# EAGLE design Weather_Station (EAGLE 9.6.2)
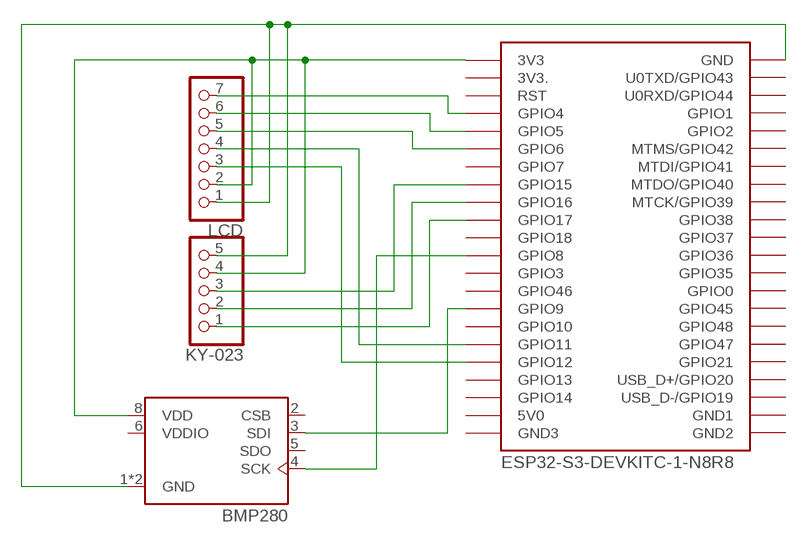
[diagram p0: schematic, sheet 1]

## Parts
KY-023  PINHD-1X5  [1X05]
LCD  PINHD-1X7  [1X07]
U1  BMP280  [XDCR_BMP280]
U$1  ESP32-S3-DEVKITC-1-N8R8  [ESP32-S3-DEVKITC-1-N8R8]

## Nets
N$1: LCD.7 U$1.J1_4(GPIO4)
N$2: LCD.6 U$1.J1_5(GPIO5)
N$3: LCD.5 U$1.J1_6(GPIO6)
N$4: KY-023.3 U$1.J1_8(GPIO15)
N$5: KY-023.2 U$1.J1_9(GPIO16)
N$6: KY-023.1 U$1.J1_10(GPIO17)
N$7: KY-023.4 LCD.2 U1.8(VDD) U$1.J1_1(3V3)
N$8: KY-023.5 LCD.1 U1.1(GND) U1.7(GND) U$1.J3_1(GND)
N$9: U1.4(SCK) U$1.J1_12(GPIO8)
N$10: LCD.4 U$1.J1_17(GPIO11)
N$11: LCD.3 U$1.J1_18(GPIO12)
N$12: U1.3(SDI) U$1.J1_15(GPIO9)
Unconnected: U1.2(CSB) U1.5(SDO) U$1.J1_3(RST) U$1.J1_7(GPIO7) U$1.J1_11(GPIO18) U$1.J1_13(GPIO3) U$1.J1_14(GPIO46) U$1.J1_16(GPIO10) U$1.J1_19(GPIO13) U$1.J1_20(GPIO14) U$1.J3_2(U0TXD/GPIO43) U$1.J3_3(U0RXD/GPIO44) U$1.J3_4(GPIO1) U$1.J3_5(GPIO2) U$1.J3_6(MTMS/GPIO42) U$1.J3_7(MTDI/GPIO41) U$1.J3_8(MTDO/GPIO40) U$1.J3_9(MTCK/GPIO39) U$1.J3_10(GPIO38) U$1.J3_11(GPIO37) U$1.J3_12(GPIO36) U$1.J3_13(GPIO35) U$1.J3_14(GPIO0) U$1.J3_15(GPIO45) U$1.J3_16(GPIO48) U$1.J3_17(GPIO47) U$1.J3_18(GPIO21) U$1.J3_19(USB_D+/GPIO20) U$1.J3_20(USB_D-/GPIO19)

## Power pins joined to a net without a drawn wire
3V3.: U$1.J1_2(3V3.)
5V0: U$1.J1_21(5V0)
GND1: U$1.J3_21(GND1)
GND2: U$1.J3_22(GND2)
GND3: U$1.J1_22(GND3)
VDDIO: U1.6(VDDIO)

## Library data of the parts
KY-023 = pinhead:PINHD-1X5: PIN HEADER
LCD = pinhead:PINHD-1X7: PIN HEADER
U1 = BMP280:BMP280: Check availability <https://pricing.snapeda.com/parts/BMP280/Bosch/view-part?ref=eda>; AVAILABILITY: In Stock; CHECK_PRICES: https://www.snapeda.com/parts/BMP280/Bosch/view-part/?ref=eda; DESCRIPTION: Pressure Sensor 4.35PSI ~ 15.95PSI (30kPa ~ 110kPa) Absolute - 16b 8-SMD; MF: Bosch; MP: BMP280; PACKAGE: SMD-8 Bosch Sensortec; PRICE: None; PURCHASE-URL: https://www.snapeda.com/api/url_track_click_mouser/?unipart_id=1186631&manufacturer=Bosch&part_name=BMP280&search_term=bmp280; SNAPEDA_LINK: https://www.snapeda.com/parts/BMP280/Bosch/view-part/?ref=snap
U$1 = ESP32-S3-DEVKITC-1-N8R8:ESP32-S3-DEVKITC-1-N8R8: Check availability <https://pricing.snapeda.com/parts/ESP32-S3-DEVKITC-1-N8R8/Espressif%20Systems/view-part?ref=eda>; AVAILABILITY: In Stock; CHECK_PRICES: https://www.snapeda.com/parts/ESP32-S3-DEVKITC-1-N8R8/Espressif+Systems/view-part/?ref=eda; DESCRIPTION: The ESP32-S3-DEVKITC-1-N8R8 from Espressif Systems is a development board designed for RF, RFID, and wireless applications. It supports 802.11 b/g/n Wi-Fi and Bluetooth® 5.x (BLE) connectivity at 2.4GHz, making it ideal for IoT and wireless communication projects. This board is powered by the ESP32-S3-WROOM-1-N8R8 module, which features 8MB Quad SPI Flash and 8MB Octal SPI for efficient memory storage and processing.; MF: Espressif Systems; MP: ESP32-S3-DEVKITC-1-N8R8; PACKAGE: None; PRICE: None; PURCHASE-URL: https://www.snapeda.com/api/url_track_click_mouser/?unipart_id=8940048&manufacturer=Espressif Systems&part_name=ESP32-S3-DEVKITC-1-N8R8&search_term=esp32-s3-devkitc; SNAPEDA_LINK: https://www.snapeda.com/parts/ESP32-S3-DEVKITC-1-N8R8/Espressif+Systems/view-part/?ref=snap

## Board
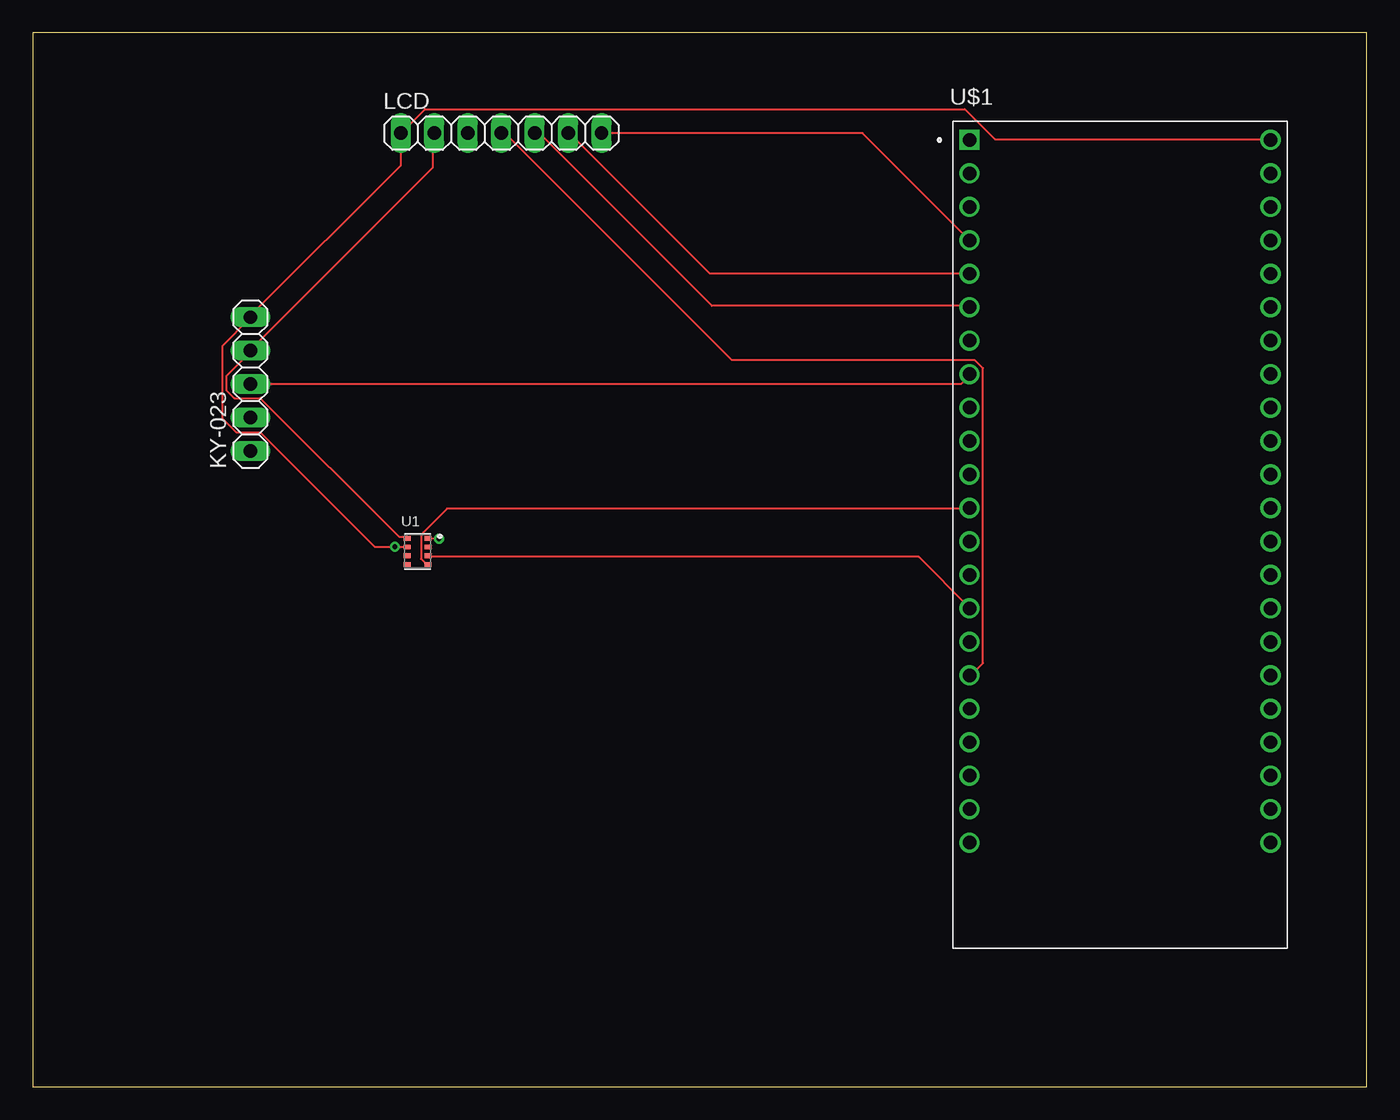
[diagram p1: board, top side]
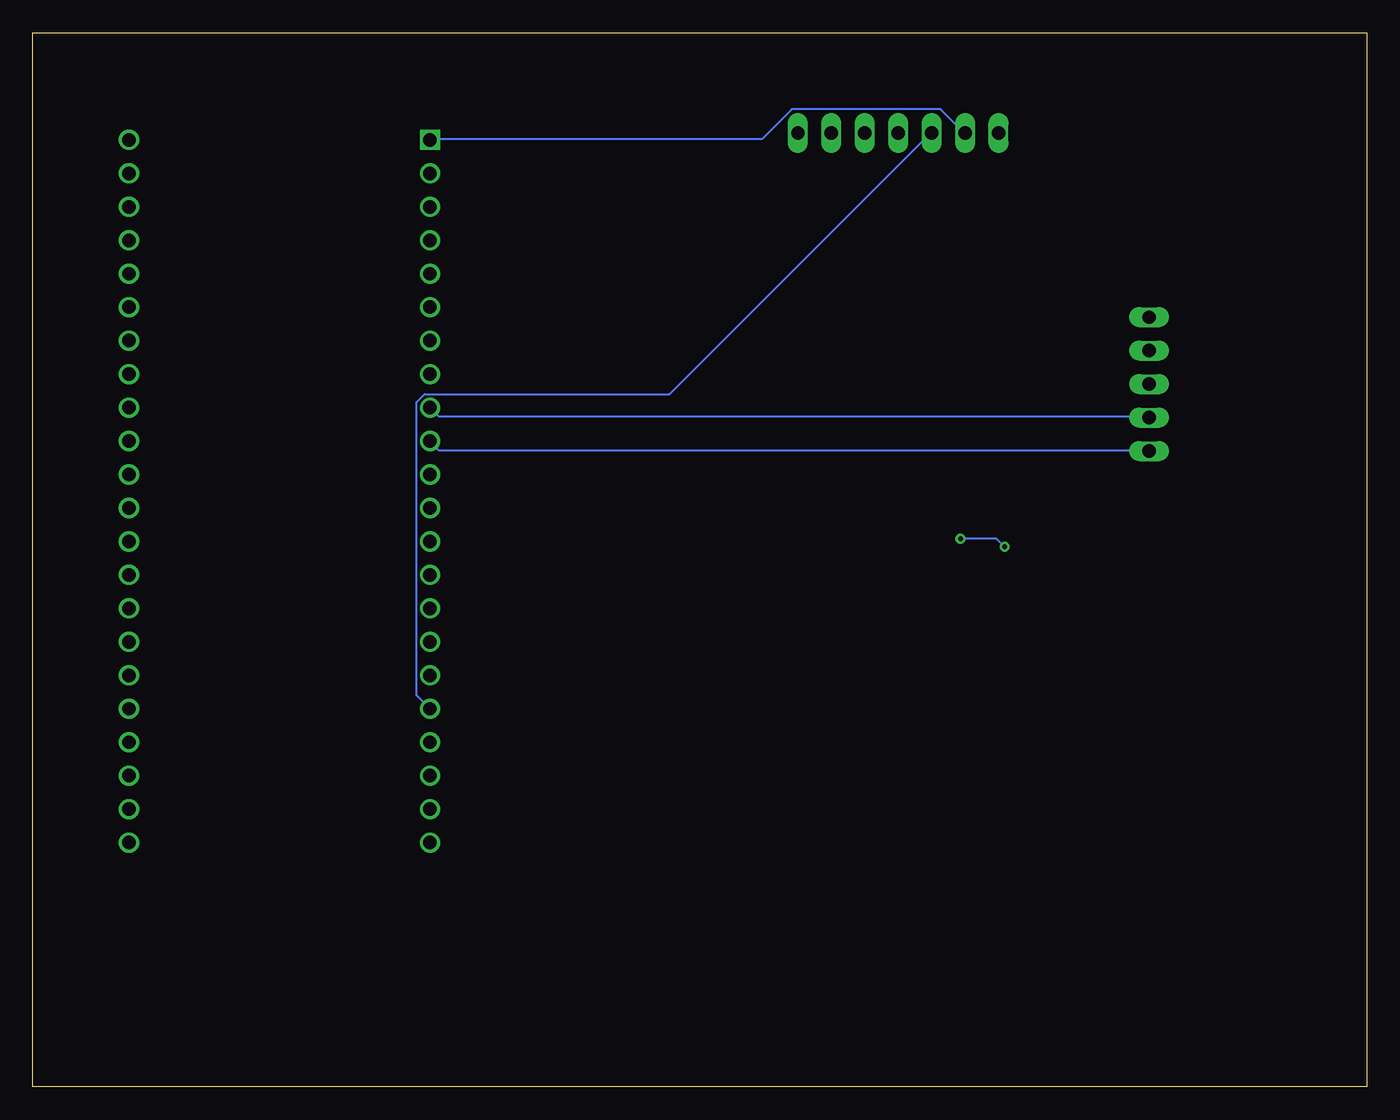
[diagram p2: board, bottom side, seen from below]

Size 101.27 x 80 mm. Coordinates in mm from the lower left corner, seen from the top.
Outline: 0,0 101.27,0 101.27,80 0,80 0,0
Copper layers (1*16): Top 0.035mm / dielectric 1.5mm / Bottom 0.035mm
Design rules "default": minimum track width 6mil, minimum drill 0.35mm, track to track 6mil, track to pad 6mil, pad to pad 6mil, via to via 6mil, smd to smd 6mil, copper to edge 40mil, drill to drill 6mil, minimum pad ring 10mil, minimum via ring 8mil, stop-mask expansion 4mil, vias tented up to drill 0mil, thermal gap 10mil

### Footprints (pad centres in the part's own frame; a part is rotated, then mirrored left to right if it is on the bottom)
1X05 = drill 1.016 long: 1 -5.08,0; 2 -2.54,0; 3 0,0; 4 2.54,0; 5 5.08,0
1X07 = drill 1.016 long: 1 -7.62,0; 2 -5.08,0; 3 -2.54,0; 4 0,0; 5 2.54,0; 6 5.08,0; 7 7.62,0
XDCR_BMP280 = smd 0.5 x 0.35: 1 0.8,0.975; 2 0.8,0.325; 3 0.8,-0.325; 4 0.8,-0.975; 5 -0.8,-0.975; 6 -0.8,-0.325; 7 -0.8,0.325; 8 -0.8,0.975
ESP32-S3-DEVKITC-1-N8R8 = drill 1.02 square: J1_1 -11.43,29.97 | drill 1.02: J1_2 -11.43,27.43; J1_3 -11.43,24.89; J1_4 -11.43,22.35; J1_5 -11.43,19.81; J1_6 -11.43,17.27; J1_7 -11.43,14.73; J1_8 -11.43,12.19; J1_9 -11.43,9.65; J1_10 -11.43,7.11; J1_11 -11.43,4.57; J1_12 -11.43,2.03; J1_13 -11.43,-0.51; J1_14 -11.43,-3.05; J1_15 -11.43,-5.59; J1_16 -11.43,-8.13; J1_17 -11.43,-10.67; J1_18 -11.43,-13.21; J1_19 -11.43,-15.75; J1_20 -11.43,-18.29; J1_21 -11.43,-20.83; J1_22 -11.43,-23.37; J3_1 11.43,29.97; J3_2 11.43,27.43; J3_3 11.43,24.89; J3_4 11.43,22.35; J3_5 11.43,19.81; J3_6 11.43,17.27; J3_7 11.43,14.73; J3_8 11.43,12.19; J3_9 11.43,9.65; J3_10 11.43,7.11; J3_11 11.43,4.57; J3_12 11.43,2.03; J3_13 11.43,-0.51; J3_14 11.43,-3.05; J3_15 11.43,-5.59; J3_16 11.43,-8.13; J3_17 11.43,-10.67; J3_18 11.43,-13.21; J3_19 11.43,-15.75; J3_20 11.43,-18.29; J3_21 11.43,-20.83; J3_22 11.43,-23.37

### Placement (x,y rotation side)
KY-023  16.51,53.34 90 top
LCD  35.56,72.39 0 top
U1  29.21,40.64 0 top
U$1  82.55,41.91 0 top

### Tracks (layer width: path | path; a pad name or v marks a point on that pad's centre or on a via)
N$1
  Top 0.152: LCD.7 62.99,72.39 71.07,64.31 U$1.J1_4
N$2
  Top 0.152: LCD.6 40.74,72.39 51.41,61.72 71.07,61.72 U$1.J1_5
N$3
  Top 0.152: LCD.5 38.46,72.39 51.56,59.28 71.07,59.28 U$1.J1_6
N$4
  Top 0.152: KY-023.3 70.46,53.34 71.07,53.95 U$1.J1_8
N$5
  Bottom 0.152: KY-023.2 16.51,50.9 70.46,50.9 71.07,51.51 U$1.J1_9
N$6
  Bottom 0.152: KY-023.1 16.51,48.31 70.46,48.31 71.07,48.92 U$1.J1_10
N$7
  Top 0.152: U1.8 28.4,41.76 27.79,41.76 17.27,52.27 15.29,52.27 14.68,52.88 14.68,53.95 16.51,55.78 KY-023.4 16.51,55.93 30.38,69.8 30.38,72.39 LCD.2
  Bottom 0.152: U$1.J1_1 71.07,71.93 45.92,71.93 43.64,74.22 32.36,74.22 30.53,72.39 LCD.2
N$8  (via drill 0.35)
  Top 0.152: U1.7 28.4,41 v27.48,41 25.96,41 17.27,49.68 15.44,49.68 14.38,50.75 14.38,56.24 16.51,58.37 KY-023.5 16.51,58.52 27.94,69.95 LCD.1 29.77,74.22 70.76,74.22 73.05,71.93 93.93,71.93 U$1.J3_1 | v30.84,41.6 30.07,41.6 U1.1
  Bottom 0.152: v30.84,41.6 28.09,41.6 v27.48,41
N$9
  Top 0.152: U1.4 29.92,39.78 29.77,39.78 29.46,40.08 29.46,41.91 31.45,43.89 71.07,43.89 U$1.J1_12
N$10
  Top 0.152: LCD.4 35.87,72.39 53.09,55.17 71.53,55.17 72.14,54.56 72.14,32.16 71.22,31.24 U$1.J1_17
N$11
  Bottom 0.152: LCD.3 33.12,72.39 52.93,52.58 71.53,52.58 72.14,51.97 72.14,29.72 71.22,28.8 U$1.J1_18
N$12
  Top 0.152: U1.3 30.07,40.23 67.26,40.23 71.07,36.42 U$1.J1_15